# EAGLE schematic ECU full v2.2 (EAGLE 9.6.2)
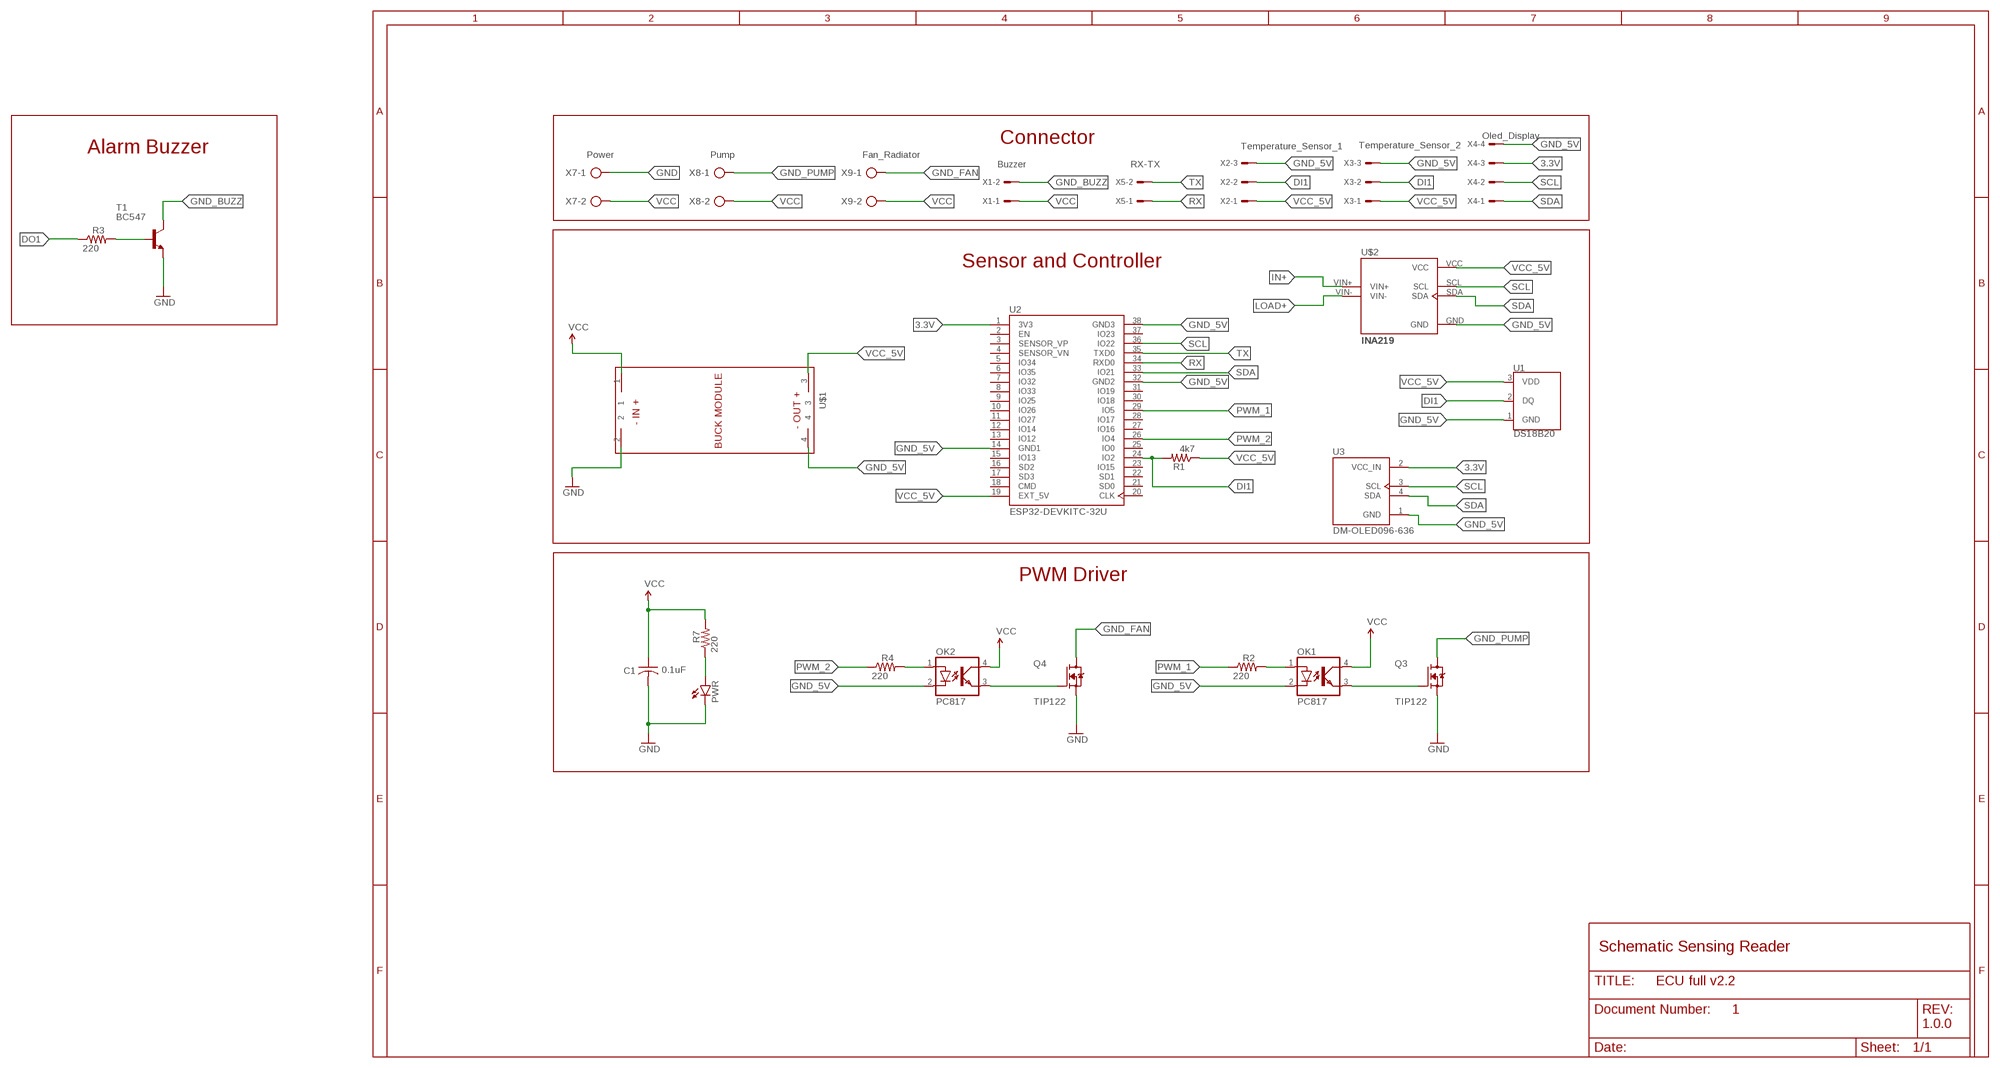
[diagram p0: schematic, sheet 1]
FRAME1 (FRAME_B_L): DESIGNER: PRATIK MAKWANA; DOC: 1; REV: 1.0.0

## Parts
C1  0.1uF  C-US050-030X075  [C050-030X075]
OK1  PC817  [DIL04]
OK2  PC817  [DIL04]
PWR  LED5MM  [LED5MM]
Q3  TIP122  IRF3205  [TO254P1041X444X2933-3]
Q4  TIP122  IRF3205  [TO254P1041X444X2933-3]
R1  4k7  R-US_0207/10  [0207/10]
R2  220  R-US_0207/10  [0207/10]
R3  220  R-US_0207/10  [0207/10]
R4  220  R-US_0207/10  [0207/10]
R7  220  R-US_0207/10  [0207/10]
T1  BC547  [TO92]
U1  DS18B20  [TO-92-AMMO]
U2  ESP32-DEVKITC-32U  [MODULE_ESP32-DEVKITC-32U]
U3  DM-OLED096-636  [MODULE_DM-OLED096-636]
U$1  BUCK_MODULEWITH_SMDPADS&THROUGHHOLES  [BUCK_MODULE]
U$2  INA219  [INA219]
X1  Buzzer  22-23-2021  [22-23-2021]
X2  Temperature_Sensor_1  22-23-2031  [22-23-2031]
X3  Temperature_Sensor_2  22-23-2031  [22-23-2031]
X4  Oled_Display  22-23-2041  [22-23-2041]
X5  RX-TX  22-23-2021  [22-23-2021]
X7  Power  AK500/2  [AK500/2]
X8  Pump  AK500/2  [AK500/2]
X9  Fan_Radiator  AK500/2  [AK500/2]

## Nets
3.3V: U2.1(3V3) U3.2(VCC_IN) X4.3
DI1: R1.2 U1.2(DQ) U2.24(IO2) X2.2 X3.2
DO1: R3.1
GND: C1.2 PWR.K(C) Q3.3(S) Q4.3(S) T1.1(E) U$1.2 X7.1
GND_5V: OK1.2(C) OK2.2(C) U1.1(GND) U2.14(GND1) U2.32(GND2) U2.38(GND3) U3.1(GND) U$1.4 U$2.GND X2.3 X3.3 X4.4
GND_BUZZ: T1.3(C) X1.2
GND_FAN: Q4.2(D) X9.1
GND_PUMP: Q3.2(D) X8.1
IN+: U$2.VIN+
LOAD+: U$2.VIN-
N$1: OK1.1(A) R2.2
N$15: OK1.3(EMIT) Q3.1(G)
N$16: OK2.1(A) R4.2
N$17: OK2.3(EMIT) Q4.1(G)
N$30: PWR.A R7.1
N$33: R3.2 T1.2(B)
PWM_1: R2.1 U2.29(IO5)
PWM_2: R4.1 U2.26(IO4)
RX: U2.34(RXD0) X5.1
SCL: U2.36(IO22) U3.3(SCL) U$2.SCL X4.2
SDA: U2.33(IO21) U3.4(SDA) U$2.SDA X4.1
TX: U2.35(TXD0) X5.2
VCC: C1.1 OK1.4(COL) OK2.4(COL) R7.2 U$1.1 X1.1 X7.2 X8.2 X9.2
VCC_5V: R1.1 U1.3(VDD) U2.19(EXT_5V) U$1.3 U$2.VCC X2.1 X3.1
Unconnected: U2.2(EN) U2.3(SENSOR_VP) U2.4(SENSOR_VN) U2.5(IO34) U2.6(IO35) U2.7(IO32) U2.8(IO33) U2.9(IO25) U2.10(IO26) U2.11(IO27) U2.12(IO14) U2.13(IO12) U2.15(IO13) U2.16(SD2) U2.17(SD3) U2.18(CMD) U2.20(CLK) U2.21(SD0) U2.22(SD1) U2.23(IO15) U2.25(IO0) U2.27(IO16) U2.28(IO17) U2.30(IO18) U2.31(IO19) U2.37(IO23)

## Notes on the sheet
- Connector
- Alarm Buzzer
- Sensor and Controller
- PWM Driver
- Schematic Sensing Reader

## Library data of the parts
C1 = adafruit:C-US: CAPACITOR, American symbol
OK1 OK2 = optocoupler:PC817: SHARP OPTO COUPLER; MPN: PC817X4J000F; OC_FARNELL: 9707727; OC_NEWARK: 97K7059
PWR = led:LED: LED OSRAM: - CHIPLED LG R971, LG N971, LY N971, LG Q971, LY Q971, LO R971, LY R971 LH N974, LH R974 LS Q976, LO Q976, LY Q976 LO Q996 - Hyper CHIPLED LW Q18S LB Q993, LB Q99A, LB R99A - SideLED LS A670, LO A670, LY A670, LG A670, LP A670 LB A673, LV A673, LT A673, LW A673 LH A674 LY A675 LS A676, LA A676, LO A676, LY A676, LW A676 LS A679, LY A679, LG A679 - Hyper Micro SIDELED® LS Y876, LA Y876, LO Y876, LY Y876 LT Y87S - SmartLED LW L88C, LW L88S LB L89C, LB L89S, LG L890 LS L89K, LO L89K, LY L89K LS L896, LA L896, LO L896, LY L896 - TOPLED LS T670, LO T670, LY T670, LG T670, LP T670 LSG T670, LSP T670, LSY T670, LOP T670, LYG T670 LG T671, LOG T671, LSG T671 LB T673, LV T673, LT T673, LW T673 LH T674 LS T676, LA T676, LO T676, LY T676, LB T676, LH T676, LSB T676, LW T676 LB T67C, LV T67C, LT T67C, LS T67K, LO T67K, LY T67K, LW E67C LS E67B, LA E67B, LO E67B, LY E67B, LB E67C, LV E67C, LT E67C LW T67C LS T679, LY T679, LG T679 LS T770, LO T770, LY T770, LG T770, LP T770 LB T773, LV T773, LT T773, LW T773 LH T774 LS E675, LA E675, LY E675, LS T675 LS T776, LA T776, LO T776, LY T776, LB T776 LHGB T686 LT T68C, LB T68C - Hyper Mini TOPLED® LB M676 - Mini TOPLED Santana® LG M470 LS M47K, LO M47K, LY M47K Source: http://www.osram.convergy.de LUXEON: - LUMILED® LXK2-PW12-R00, LXK2-PW12-S00, LXK2-PW14-U00, LXK2-PW14-V00 LXK2-PM12-R00, LXK2-PM12-S00, LXK2-PM14-U00 LXK2-PE12-Q00, LXK2-PE12-R00, LXK2-PE12-S00, LXK2-PE14-T00, LXK2-PE14-U00 LXK2-PB12-K00, LXK2-PB12-L00, LXK2-PB12-M00, LXK2-PB14-N00, LXK2-PB14-P00, LXK2-PB14-Q00 LXK2-PR12-L00, LXK2-PR12-M00, LXK2-PR14-Q00, LXK2-PR14-R00 LXK2-PD12-Q00, LXK2-PD12-R00, LXK2-PD12-S00 LXK2-PH12-R00, LXK2-PH12-S00 LXK2-PL12-P00, LXK2-PL12-Q00, LXK2-PL12-R00 Source: www.luxeon.com KINGBRIGHT: KA-3528ASYC Source: www.kingbright.com
Q3 Q4 = IRF3205:IRF3205: N-Channel 55V 75A (Tc) 170W (Tc) Through Hole TO-220AB Check availability <https://pricing.snapeda.com/parts/IRF3205/Infineon%20Technologies/view-part?ref=eda>; AVAILABILITY: In Stock; CHECK_PRICES: https://www.snapeda.com/parts/IRF3205/Infineon/view-part/?ref=eda; DESCRIPTION: N-Channel 55V 110A (Tc) 200W (Tc) Through Hole TO-220AB; MF: Infineon Technologies; MP: IRF3205; PACKAGE: TO-220 Infineon; PRICE: None; SNAPEDA_LINK: https://www.snapeda.com/parts/IRF3205/Infineon/view-part/?ref=snap
R1-R4 R7 = adafruit:R-US_: RESISTOR, American symbol
T1 = transistor:BC547: NPN TRANSISTOR
U1 = DS18B20:DS18B20: Dallas/Maxim DS18B20 1-Wire Temperature Sensor The DS18B20 reports degrees C with 9 to 12-bit precision, -55C to 125C (+/-0.5C). Each sensor has a unique 64-Bit Serial number etched into it - allows for a huge number of sensors to be used on one data bus. Datasheet <http://datasheets.maximintegrated.com/en/ds/DS18B20.pdf> SparkFun Products One Wire Digital Temperature Sensor - DS18B20 <https://www.sparkfun.com/products/245> (SEN-00245) Check availability <https://pricing.snapeda.com/parts/DS18B20/UMW/view-part?ref=eda>; AVAILABILITY: In Stock; CHECK_PRICES: https://www.snapeda.com/parts/DS18B20/UMW/view-part/?ref=eda; DESCRIPTION: Temperature Sensor Digital, Local -55°C ~ 125°C 9 b, 10 b, 11 b, 12 b TO-92; MF: UMW; MP: DS18B20; PACKAGE: None; PRICE: None; SNAPEDA_LINK: https://www.snapeda.com/parts/DS18B20/UMW/view-part/?ref=snap
U2 = ESP32-DEVKITC-32U:ESP32-DEVKITC-32U: Check availability <https://pricing.snapeda.com/parts/ESP32-DEVKITC-32U/Espressif%20Systems/view-part?ref=eda>; AVAILABILITY: In Stock; CHECK_PRICES: https://www.snapeda.com/parts/ESP32-DEVKITC-32U/Espressif+Systems/view-part/?ref=eda; DESCRIPTION: ESP32-WROOM-32UE series Transceiver; 802.11 b/g/n (Wi-Fi, WiFi, WLAN), Bluetooth® Smart Ready 4.x Dual Mode Evaluation Board; MF: Espressif Systems; MP: ESP32-DEVKITC-32U; PACKAGE: CUSTOM-38 ESPRESSIF; PRICE: None; SNAPEDA_LINK: https://www.snapeda.com/parts/ESP32-DEVKITC-32U/Espressif+Systems/view-part/?ref=snap
U3 = DM-OLED096-636:DM-OLED096-636: Check availability <https://pricing.snapeda.com/parts/DM-OLED096-636/Display%20Module/view-part?ref=eda>; AVAILABILITY: Not in stock; CHECK_PRICES: https://www.snapeda.com/parts/DM-OLED096-636/Display+Module/view-part/?ref=eda; DESCRIPTION: 0.96” 128 X 64 MONOCHROME GRAPHIC OLED DISPLAY MODULE - I2C; MF: Display Module; MP: DM-OLED096-636; PACKAGE: Package; PRICE: None; SNAPEDA_LINK: https://www.snapeda.com/parts/DM-OLED096-636/Display+Module/view-part/?ref=snap
U$1 = BUCK_MODULE:BUCK_MODULE
U$2 = INA219:INA219
X1 X5 = con-molex:22-23-2021: .100" (2.54mm) Center Header - 2 Pin; MF: MOLEX; MPN: 22-23-2021; OC_FARNELL: 1462926; OC_NEWARK: 25C3832
X2 X3 = con-molex:22-23-2031: .100" (2.54mm) Center Header - 3 Pin; MF: MOLEX; MPN: 22-23-2031; OC_FARNELL: 1462950; OC_NEWARK: 30C0862
X4 = con-molex:22-23-2041: .100" (2.54mm) Center Header - 4 Pin; MF: MOLEX; MPN: 22-23-2041; OC_FARNELL: 1462920; OC_NEWARK: 38C0355
X7-X9 = con-ptr500:AK500/2: CONNECTOR; OC_FARNELL: unknown; OC_NEWARK: unknown